# Altium schematic sheet sheet1_final.SchDoc
size A; SheetNumber: 1; SheetTotal: 1
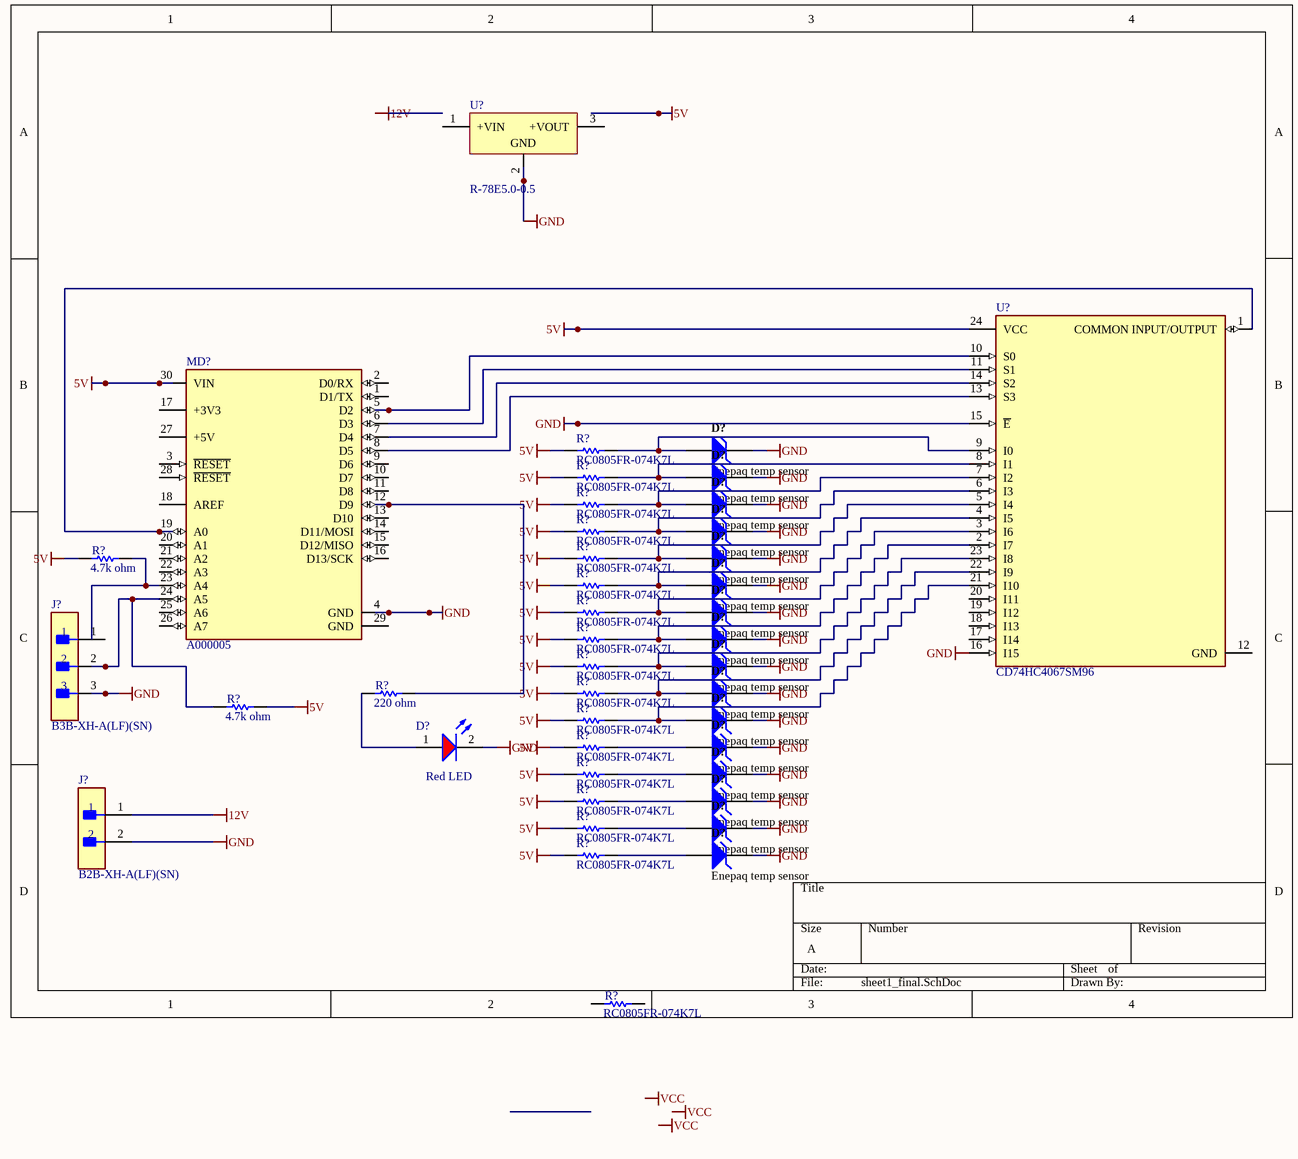
[diagram p0: sheet1_final.SchDoc]

## Parts
(Parts that share a designator on the sheet are numbered #1, #2 ... from top to bottom, then left to right.)
D?#1  Enepaq temp sensor  [FAIR-DO-41-2_V]
D?#2  Enepaq temp sensor  [FAIR-DO-41-2_V]
D?#3  Enepaq temp sensor  [FAIR-DO-41-2_V]
D?#4  Enepaq temp sensor  [FAIR-DO-41-2_V]
D?#5  Enepaq temp sensor  [FAIR-DO-41-2_V]
D?#6  Enepaq temp sensor  [FAIR-DO-41-2_V]
D?#7  Enepaq temp sensor  [FAIR-DO-41-2_V]
D?#8  Enepaq temp sensor  [FAIR-DO-41-2_V]
D?#9  Enepaq temp sensor  [FAIR-DO-41-2_V]
D?#10  Enepaq temp sensor  [FAIR-DO-41-2_V]
D?#11  Enepaq temp sensor  [FAIR-DO-41-2_V]
D?#12  Enepaq temp sensor  [FAIR-DO-41-2_V]
D?#13  Red LED  [WL-TMRC_D5.9H8.7]
D?#14  Enepaq temp sensor  [FAIR-DO-41-2_V]
D?#15  Enepaq temp sensor  [FAIR-DO-41-2_V]
D?#16  Enepaq temp sensor  [FAIR-DO-41-2_V]
D?#17  Enepaq temp sensor  [FAIR-DO-41-2_V]
J?#1  B3B-XH-A(LF)(SN)  [FP-B3B-XH-A_LF_SN-MFG]
J?#2  B2B-XH-A(LF)(SN)  [FP-B2B-XH-A_LF_SN-MFG]
MD?  A000005  [FP-A000005-MFG]
R?#1  RC0805FR-074K7L  [YAGO-RC0805_M]
R?#2  RC0805FR-074K7L  [YAGO-RC0805_M]
R?#3  RC0805FR-074K7L  [YAGO-RC0805_M]
R?#4  RC0805FR-074K7L  [YAGO-RC0805_M]
R?#5  4.7k ohm  [YAGO-RC0805_M]
R?#6  RC0805FR-074K7L  [YAGO-RC0805_M]
R?#7  RC0805FR-074K7L  [YAGO-RC0805_M]
R?#8  RC0805FR-074K7L  [YAGO-RC0805_M]
R?#9  RC0805FR-074K7L  [YAGO-RC0805_M]
R?#10  RC0805FR-074K7L  [YAGO-RC0805_M]
R?#11  220 ohm  [YAGO-RC0805_M]
R?#12  RC0805FR-074K7L  [YAGO-RC0805_M]
R?#13  4.7k ohm  [YAGO-RC0805_M]
R?#14  RC0805FR-074K7L  [YAGO-RC0805_M]
R?#15  RC0805FR-074K7L  [YAGO-RC0805_M]
R?#16  RC0805FR-074K7L  [YAGO-RC0805_M]
R?#17  RC0805FR-074K7L  [YAGO-RC0805_M]
R?#18  RC0805FR-074K7L  [YAGO-RC0805_M]
R?#19  RC0805FR-074K7L  [YAGO-RC0805_M]
R?#20  RC0805FR-074K7L  [YAGO-RC0805_M]
U?#1  R-78E5.0-0.5  [REPO-R-78E-0.5-3_V]
U?#2  CD74HC4067SM96  [FP-DB0024A-IPC_C]

## Nets
5V: MD?.30(VIN) R?#1.1 R?#2.1 R?#3.1 R?#4.1 R?#5.1 R?#6.1 R?#7.1 R?#8.1 R?#9.1 R?#10.1 R?#12.1 R?#13.2 R?#14.1 R?#15.1 R?#16.1 R?#17.1 R?#18.1 R?#19.1 U?#2.24(VCC)
12V: J?#2.1
GND: D?#1.2(K) D?#2.2(K) D?#3.2(K) D?#4.2(K) D?#5.2(K) D?#6.2(K) D?#7.2(K) D?#8.2(K) D?#9.2(K) D?#10.2(K) D?#11.2(K) D?#12.2(K) D?#13.2(K) D?#14.2(K) D?#15.2(K) D?#16.2(K) D?#17.2(K) J?#1.3 J?#2.2 MD?.4(GND) U?#1.2(GND) U?#2.15(~{E}) U?#2.16(I15)
NetD?#1_1: D?#1.1(A) R?#1.2 U?#2.9(I0)
NetD?#2_1: D?#2.1(A) R?#2.2 U?#2.8(I1)
NetD?#3_1: D?#3.1(A) R?#3.2 U?#2.7(I2)
NetD?#4_1: D?#4.1(A) R?#4.2 U?#2.6(I3)
NetD?#5_1: D?#5.1(A) R?#6.2 U?#2.5(I4)
NetD?#6_1: D?#6.1(A) R?#7.2 U?#2.4(I5)
NetD?#7_1: D?#7.1(A) R?#8.2 U?#2.3(I6)
NetD?#8_1: D?#8.1(A) R?#9.2 U?#2.2(I7)
NetD?#9_1: D?#9.1(A) R?#10.2 U?#2.23(I8)
NetD?#10_1: D?#10.1(A) R?#12.2 U?#2.22(I9)
NetD?#11_1: D?#11.1(A) R?#14.2 U?#2.21(I10)
NetD?#12_1: D?#12.1(A) R?#15.2
NetD?#13_1: D?#13.1(A) R?#11.1
NetD?#14_1: D?#14.1(A) R?#16.2
NetD?#15_1: D?#15.1(A) R?#17.2
NetD?#16_1: D?#16.1(A) R?#18.2
NetD?#17_1: D?#17.1(A) R?#19.2
NetJ?#1_2: J?#1.2 MD?.24(A5) R?#13.1
NetMD?_5: MD?.5(D2) U?#2.10(S0)
NetMD?_6: MD?.6(D3) U?#2.11(S1)
NetMD?_7: MD?.7(D4) U?#2.14(S2)
NetMD?_8: MD?.8(D5) U?#2.13(S3)
NetMD?_12: MD?.12(D9) R?#11.2
NetMD?_19: MD?.19(A0) U?#2.1(COMMON_INPUT/OUTPUT)
NetMD?_23: MD?.23(A4) R?#5.2

Not connected (* = marked no-connect by the designer): J?#1 1; MD? 1(D1/TX) 2(D0/RX) 3(~{RESET}) 9(D6) 10(D7) 11(D8) 13(D10) 14(D11/MOSI) 15(D12/MISO) 16(D13/SCK) 17(+3V3) 18(AREF) 20(A1) 21(A2) 22(A3) 25(A6) 26(A7) 27(+5V) 28(~{RESET}) 29(GND); R?#20 1 2; U?#1 1(+VIN) 3(+VOUT); U?#2 12(GND) 17(I14) 18(I13) 19(I12) 20(I11)

## Notes on the sheet
- Labels drawn without touching a wire or pin: 12V, VCC

## Library data of the parts
D?#1-D?#12 D?#14-D?#17 = CMP-0892-00010-1: Zener Diode, 5.1V, 1W, 5%, -65 to 200 degC, 2-Pin DO-41, Body 2.72 x 5.2 mm, RoHS; PartNumber: 1N4733A; Manufacturer: Fairchild Semiconductor; VZ (Max.) (V): 5.355; VZ (Min.) (V): 4.845; Test Current IZ (mA): 49; IR (uA): 10; PD (W): 1; ZZ (Max) (ohm): 7; PackageVersion: Rev. 2; Operating and Storage Temperature Range: -65 to 200 degC; Tolerance: 5%; ComponentLink3URL: http://www.fairchildsemi.com/dwg/DO/DO41A.pdf; ComponentLink1URL: http://www.fairchildsemi.com/; PackageDescription: 2-Pin Axial leaded, Body 2.72 x 5.2 mm, Lead Spread 25.4 mm; ComponentLink2Description: Datasheet; RoHS: TRUE; ComponentLink3Description: Package Specification; ComponentLink2URL: http://www.fairchildsemi.com/ds/1N/1N4744A.pdf; ComponentLink1Description: Manufacturer URL; PackageReference: DO-41-2; DatasheetVersion: Rev. H3; Mounting Technology: Through Hole
D?#13 = CMP-1488-00008-3: WL-TMRC Red Color Diffused 5 mm Round Through Hole LED; Manufacturer Lifecycle Status: ACTIVE; Forward Voltage: 2.1V; YEOL: 1 = Estimated lifetime > 10 years; Lens Size: 5mm; Lens Style: Circular, Diffused, Round; Luminous Intensity: 30mcd; Test Current: 20mA; Viewing Angle: 60°; Wavelength: 630nm; Max Reverse Voltage (DC): 5V; Forward Current: 100mA; Dominant Wavelength: 645nm; Peak Wavelength: 650nm; Height: 8.6mm; REACH SVHC: Unknown; Width: 5mm; RoHS: Compliant; Mount: Through Hole; Case/Package: Radial; Min Operating Temperature: -40°C; Length: 5mm; Max Operating Temperature: 85°C; Packaging: Bulk; Color: Red; Lifecycle Status: Production
J?#1 = CMP-17439-000014-3: CONN HEADER VERT 3POS 2.5MM; Max Voltage Rating (DC): 250V; Number of Positions: 3; Current Rating: 3A; Gender: Male; Wire/Cable Gauge: 22AWG; Contact Resistance: 20mR; Insulation Resistance: 1GR; Insulation Material: Nylon; Contact Plating: Tin; Depth: 5.75mm; Contact Type: Male Pin; Max Operating Temperature: 85°C; Insulation Color: Natural; Voltage Rating (AC): 250V; Color: Natural; Connector Type: Header; Orientation: Straight; Fastening Type: Detent; Housing Color: White; Min Operating Temperature: -25°C; Termination: Solder; Voltage Rating: 250V; Series: XH; Pitch: 2.5mm; Contact Shape: Square; Number of Rows: 1; Lead Free: Lead Free; Packaging: Bulk; Mount: Through Hole; Flammability Rating: UL94 V-0; Max Voltage Rating (AC): 250V; REACH SVHC: No SVHC; Housing Material: Polyamide; Contact Material: Brass; Lead Pitch: 2.5mm; Contact Finish - Mating: TIN; Length: 9.9mm; Max Current Rating: 3A; Number of Contacts: 3
J?#2 = CMP-2000-05888-3: CONN HEADER VERT 2POS 2.5MM; Current Rating: 3A; Voltage Rating: 250V; Number of Contacts: 2; Contact Resistance: 20mR; Wire/Cable Gauge: 22AWG; Insulation Resistance: 1GR; Connector Type: Male Pin; Packaging: Bulk; Contact Material: Brass; Lead Free: Lead Free; Orientation: Straight; Contact Plating: Tin; Max Current Rating: 3A; Termination: Solder; Fastening Type: Detent; Depth: 5.75mm; Housing Material: Polyamide; REACH SVHC: No SVHC; Series: XH; Voltage Rating (AC): 250V; Number of Positions: 2; Color: Natural; Contact Type: Male Pin; Max Voltage Rating (DC): 250V; Pitch: 2.5mm; Lead Pitch: 2.5mm; Mount: Through Hole; Max Operating Temperature: 85°C; Length: 7.4mm; Max Voltage Rating (AC): 250V; Min Operating Temperature: -25°C; Number of Rows: 1; Housing Color: White
MD? = CMP-189986-000002-1: ARDUINO NANO ATMEGA328 EVAL BRD; Number of Bits: 8; Evaluation Kit: Yes; Operating Supply Voltage: 12V; Interface: I2C; Data Bus Width: 8b; Core Architecture: AVR; Packaging: Bulk; Length: 7inch; Package Quantity: 50; Width: 5inch; REACH SVHC: No SVHC; Weight: 0.358383oz; Series: AVR® ATmega; Height: 0.25inch
R?#1-R?#4 R?#6-R?#10 R?#12 R?#14-R?#20 = CMP-1568-00001-1: General Puprose Chip Resistor, 4700 Ohm +/- 1%, 0.125 W, -55 to 155 degC, 2-Pin SMD, RoHS, Tape and Reel; Tolerance: +/- 1%; Power: 0.125 W; PackageDescription: 2-Pin Surface Mount Device, Body 2 x 1.25 mm; ComponentLink2URL: http://www.yageo.com/documents/recent/PYu-RC_Group_51_RoHS_L-3.pdf; Temperature Min: -55 degC; Packing: Tape and Reel; Mounting Technology: Surface Mount; PartNumber: RC0805FR-074K7L; ComponentLink1URL: http://www.yageo.com/NewPortal/_en/index.jsp; Resistance: 4700 Ohm; Temperature Max: 155 degC; ComponentLink2Description: Datasheet; DatasheetVersion: Rev. 3; RoHS: TRUE; ComponentLink1Description: Manufacturer URL
R?#5 R?#11 R?#13 = CMP-1568-00001-1: General Puprose Chip Resistor, 4700 Ohm +/- 1%, 0.125 W, -55 to 155 degC, 2-Pin SMD, RoHS, Tape and Reel; PartNumber: RC0805FR-074K7L; Tolerance: +/- 1%; Power: 0.125 W; PackageDescription: 2-Pin Surface Mount Device, Body 2 x 1.25 mm; ComponentLink2URL: http://www.yageo.com/documents/recent/PYu-RC_Group_51_RoHS_L-3.pdf; Temperature Min: -55 degC; Packing: Tape and Reel; Mounting Technology: Surface Mount; ComponentLink1URL: http://www.yageo.com/NewPortal/_en/index.jsp; Resistance: 4700 Ohm; Temperature Max: 155 degC; ComponentLink2Description: Datasheet; DatasheetVersion: Rev. 3; RoHS: TRUE; ComponentLink1Description: Manufacturer URL
U?#1 = CMP-2000-06922-2: DC/DC-Converter, 5 V Single Output, 500 mA, -40 to 85 degC, 3-Pin THD, RoHS, Tube; Manufacturer: Recom Power; Efficiency: 92%; Number of Outputs: 1; Current - Output (Max): 500mA; VIN Min: 7V; Package Version: Rev. 0; VIN Max: 28V; VOUT: 5V; Manufacturer URL: http://www.recom-power.com/us/americas/home.html; Operating Temperature: -40°C~85°C; Datasheet Version: 01/2017; Packaging: Tube; Package Reference: SIP Module; Datasheet URL: http://www.recom-power.com/pdf/Innoline/R-78Exx-0.5.pdf; Package Description: 3-Pin Through Hole Device, Body 11.6 x 8.5 mm, Pitch 2.54 mm; Mounting Technology: ThroughHole
U?#2 = CMP-04892-000038-1: IC MUX/DEMUX 1X16 24SSOP; Supply Type: Single; High Level Output Current: 25mA; Min Supply Voltage: 2V; Number of Circuits: 16; Max Supply Voltage: 6V; Number of Channels: 1; Turn-On Delay Time: 300ns; Max Supply Current: 8uA; Bandwidth: 89MHz; Turn-Off Delay Time: 290ns; Propagation Delay: 75ns; Logic Function: Multiplexer; On-State Resistance: 160R; Polarity: Non-Inverting; Width: 5.3mm; Case/Package: SSOP; Max Operating Temperature: 125°C; Mount: Surface Mount; Min Operating Temperature: -55°C; REACH SVHC: No SVHC; Contact Plating: Gold; Max Output Current: 25mA; Weight: 0.006081oz; Height: 1.95mm; Package Quantity: 2000; Length: 8.2mm; Lead Free: Lead Free; Operating Supply Current: 8uA; Packaging: Tape and Reel; Series: 74HC; Low Level Output Current: 25mA; Number of Outputs: 1; Termination: SMD/SMT; Number of Inputs: 16; Number of Bits: 16; Radiation Hardening: No; Number of Pins: 24